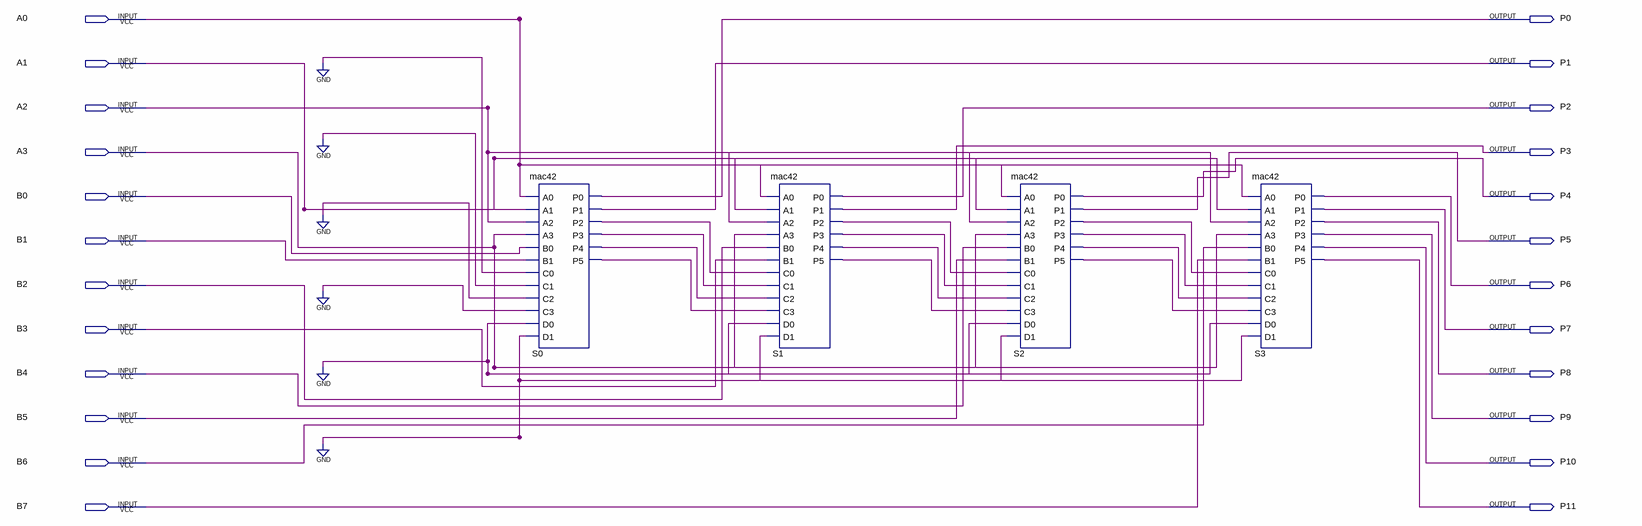
[diagram p0: schematic sheet]
// Quartus schematic mac48b.bdf as structural Verilog: 4 symbols, 24 pins
module mac48b (
  input  A0,
  input  A1,
  input  A2,
  input  A3,
  input  B0,
  input  B1,
  input  B2,
  input  B3,
  input  B4,
  input  B5,
  input  B6,
  input  B7,
  output P0,
  output P1,
  output P2,
  output P3,
  output P4,
  output P5,
  output P6,
  output P7,
  output P8,
  output P9,
  output P10,
  output P11
);

  wire S0_p2, S0_p3, S0_p4, S0_p5, S1_p2, S1_p3, S1_p4, S1_p5, S2_p2, S2_p3, S2_p4, S2_p5;

  mac42 S0 (
    .A0(A0), .A1(A1), .A2(A2), .A3(A3), .B0(B0), .B1(B1), .C0(1'b0), .C1(1'b0), .C2(1'b0), .C3(1'b0),
    .D0(1'b0), .D1(1'b0), .P0(P0), .P1(P1), .P2(S0_p2), .P3(S0_p3), .P4(S0_p4), .P5(S0_p5));
  mac42 S1 (
    .A0(A0), .A1(A1), .A2(A2), .A3(A3), .B0(B2), .B1(B3), .C0(S0_p2), .C1(S0_p3), .C2(S0_p4), .C3(S0_p5),
    .D0(1'b0), .D1(1'b0), .P0(P2), .P1(P3), .P2(S1_p2), .P3(S1_p3), .P4(S1_p4), .P5(S1_p5));
  mac42 S2 (
    .A0(A0), .A1(A1), .A2(A2), .A3(A3), .B0(B4), .B1(B5), .C0(S1_p2), .C1(S1_p3), .C2(S1_p4), .C3(S1_p5),
    .D0(1'b0), .D1(1'b0), .P0(P4), .P1(P5), .P2(S2_p2), .P3(S2_p3), .P4(S2_p4), .P5(S2_p5));
  mac42 S3 (
    .A0(A0), .A1(A1), .A2(A2), .A3(A3), .B0(B6), .B1(B7), .C0(S2_p2), .C1(S2_p3), .C2(S2_p4), .C3(S2_p5),
    .D0(1'b0), .D1(1'b0), .P0(P6), .P1(P7), .P2(P8), .P3(P9), .P4(P10), .P5(P11));
endmodule
